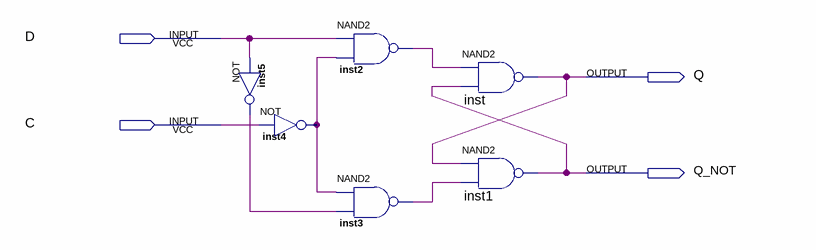
[diagram p0: schematic sheet]
// Quartus schematic WILLIAMS_DWANN_D_LATCH.bdf as structural Verilog: 6 symbols, 4 pins
module WILLIAMS_DWANN_D_LATCH (
  input  D,
  input  C,
  output Q,
  output Q_NOT
);

  wire inst2_out, inst3_out, inst4_out, inst5_out;

  not inst5 (inst5_out, D);
  not inst4 (inst4_out, C);
  nand inst2 (inst2_out, D, inst4_out);
  nand inst3 (inst3_out, inst4_out, inst5_out);
  nand inst (Q, inst2_out, Q_NOT);
  nand inst1 (Q_NOT, Q, inst3_out);
endmodule
